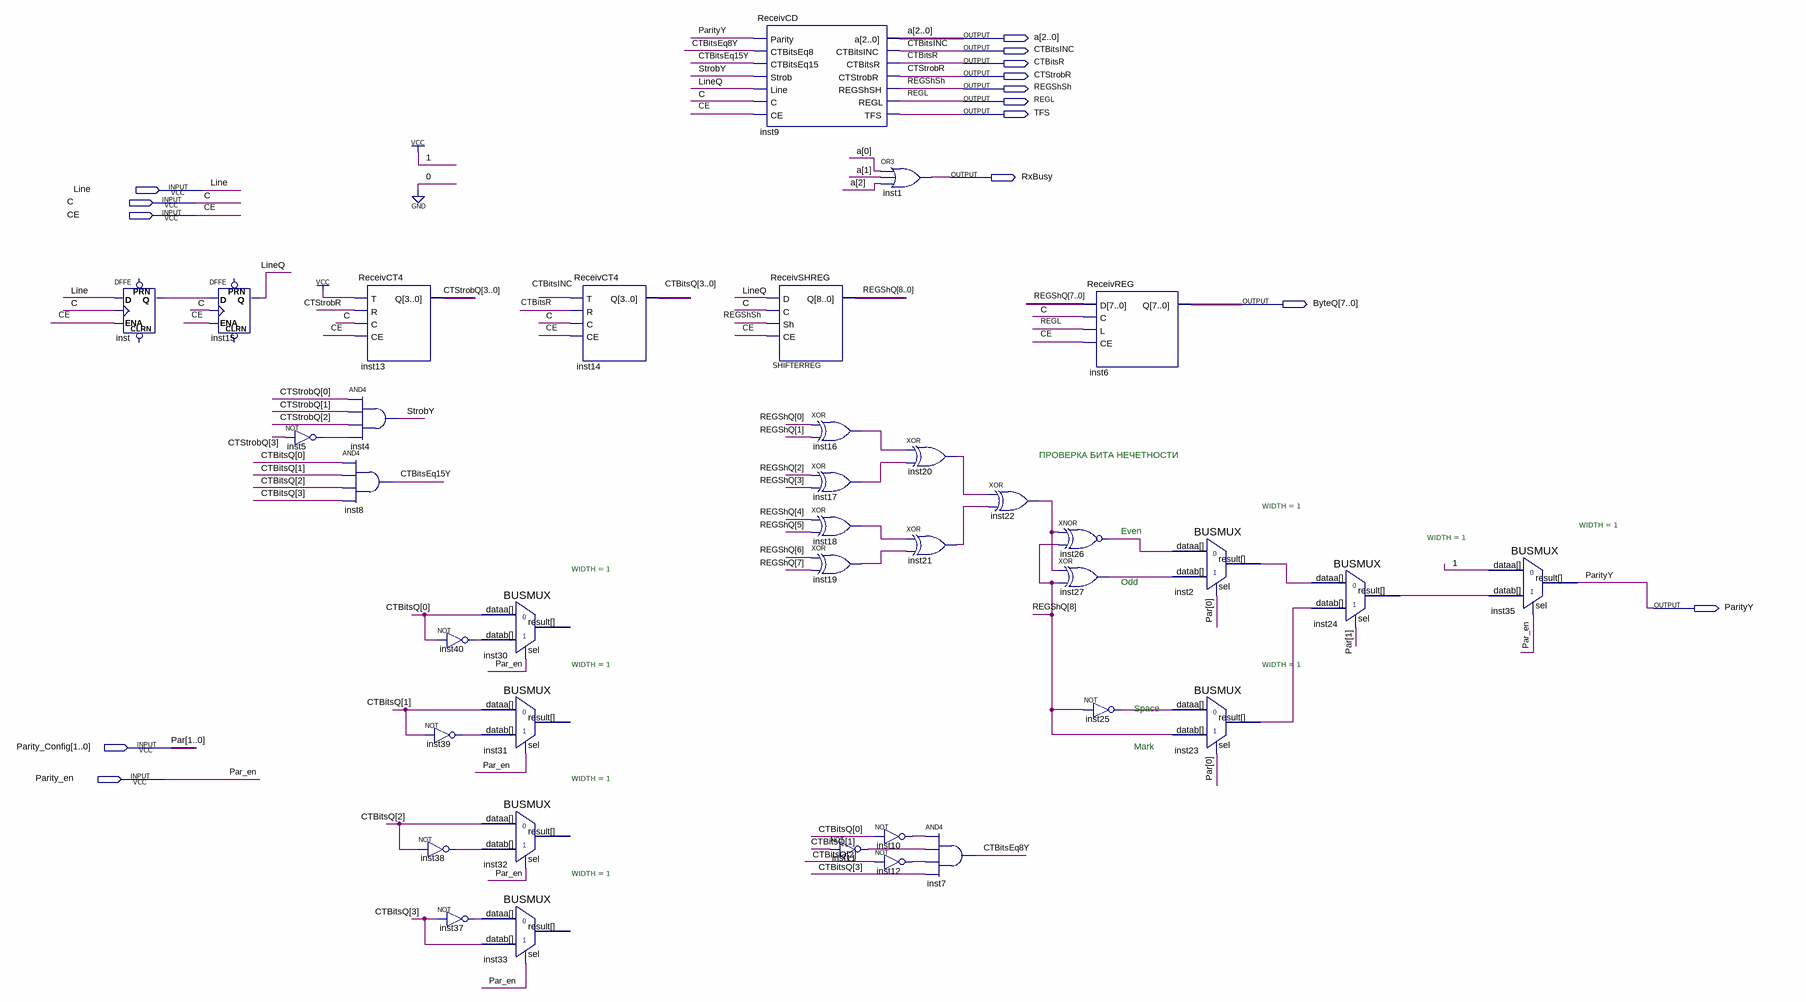
[diagram p0: schematic sheet]
// Quartus schematic Receiv.bdf as structural Verilog: 37 symbols, 15 pins
module Receiv (
  input  Line,
  input  C,
  input  CE,
  input  [1:0] Parity_Config,
  input  Parity_en,
  output [2:0] a,
  output CTBitsINC,
  output CTBitsR,
  output CTStrobR,
  output REGShSh,
  output REGL,
  output TFS,
  output RxBusy,
  output [7:0] ByteQ,
  output ParityY
);

  wire CTBitsEq8Y, CTBitsEq15Y, inst2_result, inst5_out, inst10_out, inst11_out, inst12_out, inst16_out,
       inst17_out, inst18_out, inst19_out, inst20_out, inst21_out, inst22_out, inst23_result, inst24_result,
       inst25_out, inst26_out, inst27_out, inst37_out, inst38_out, inst39_out, inst40_out, inst_q, LineQ,
       StrobY;
  wire [3:0] CTBitsQ, CTStrobQ;
  wire [8:0] REGShQ;

  DFFE inst (.D(Line), .CLK(C), .ENA(CE), .Q(inst_q));  // open: PRN, CLRN
  DFFE inst15 (.D(inst_q), .CLK(C), .ENA(CE), .Q(LineQ));  // open: PRN, CLRN
  not inst5 (inst5_out, CTStrobQ[3]);
  and inst8 (CTBitsEq15Y, CTBitsQ[0], CTBitsQ[1], CTBitsQ[2], CTBitsQ[3]);
  ReceivCT4 inst13 (.T(1'b1), .R(CTStrobR), .C(C), .CE(CE), .Q(CTStrobQ));
  and inst4 (StrobY, CTStrobQ[0], CTStrobQ[1], CTStrobQ[2], inst5_out);
  not inst40 (inst40_out, CTBitsQ[0]);
  not inst39 (inst39_out, CTBitsQ[1]);
  not inst38 (inst38_out, CTBitsQ[2]);
  not inst37 (inst37_out, CTBitsQ[3]);
  BUSMUX #(.WIDTH(1)) inst30 (.datab(inst40_out), .sel(Parity_en), .dataa(CTBitsQ[0]));  // open: result
  BUSMUX #(.WIDTH(1)) inst31 (.datab(inst39_out), .sel(Parity_en), .dataa(CTBitsQ[1]));  // open: result
  BUSMUX #(.WIDTH(1)) inst32 (.datab(inst38_out), .sel(Parity_en), .dataa(CTBitsQ[2]));  // open: result
  BUSMUX #(.WIDTH(1)) inst33 (.datab(CTBitsQ[3]), .sel(Parity_en), .dataa(inst37_out));  // open: result
  ReceivCT4 inst14 (.T(CTBitsINC), .R(CTBitsR), .C(C), .CE(CE), .Q(CTBitsQ));
  ReceivCD inst9 (
    .Parity(ParityY), .CTBitsEq8(CTBitsEq8Y), .CTBitsEq15(CTBitsEq15Y), .Strob(StrobY), .Line(LineQ), .C(C),
    .CE(CE), .a(a), .CTBitsINC(CTBitsINC), .CTBitsR(CTBitsR), .CTStrobR(CTStrobR), .REGShSH(REGShSh),
    .REGL(REGL), .TFS(TFS));
  ReceivSHREG SHIFTERREG (.D(LineQ), .C(C), .Sh(REGShSh), .CE(CE), .Q(REGShQ));
  xor inst16 (inst16_out, REGShQ[0], REGShQ[1]);
  xor inst17 (inst17_out, REGShQ[2], REGShQ[3]);
  xor inst18 (inst18_out, REGShQ[4], REGShQ[5]);
  xor inst19 (inst19_out, REGShQ[6], REGShQ[7]);
  not inst11 (inst11_out, CTBitsQ[1]);
  or inst1 (RxBusy, a[0], a[1], a[2]);
  not inst10 (inst10_out, CTBitsQ[0]);
  not inst12 (inst12_out, CTBitsQ[2]);
  xor inst20 (inst20_out, inst16_out, inst17_out);
  xor inst21 (inst21_out, inst18_out, inst19_out);
  and inst7 (CTBitsEq8Y, inst10_out, inst11_out, inst12_out, CTBitsQ[3]);
  xor inst22 (inst22_out, inst20_out, inst21_out);
  ReceivREG inst6 (.D(REGShQ[7:0]), .C(C), .L(REGL), .CE(CE), .Q(ByteQ));
  xnor inst26 (inst26_out, inst22_out, REGShQ[8]);
  xor inst27 (inst27_out, inst22_out, REGShQ[8]);
  not inst25 (inst25_out, REGShQ[8]);
  BUSMUX #(.WIDTH(1)) inst2 (.datab(inst27_out), .sel(Parity_Config[0]), .dataa(inst26_out), .result(inst2_result));
  BUSMUX #(.WIDTH(1)) inst23 (.datab(REGShQ[8]), .sel(Parity_Config[0]), .dataa(inst25_out), .result(inst23_result));
  BUSMUX #(.WIDTH(1)) inst24 (
    .datab(inst23_result), .sel(Parity_Config[1]), .dataa(inst2_result), .result(inst24_result));
  BUSMUX #(.WIDTH(1)) inst35 (.datab(inst24_result), .sel(Parity_en), .dataa(1'b1), .result(ParityY));

  // Other names for the same wires on the sheet: Par[1:0] = Parity_Config; Par_en = Parity_en

  // Notes on the sheet:
  //   ПРОВЕРКА БИТА НЕЧЕТНОСТИ
  //   Even
  //   Odd
  //   Space
  //   Mark
endmodule
